# Altium project Ezlo_Voice_AssistantHUB.PrjPcb (part 5 of 10)

## Sheet Power_Sheet_2.SchDoc
size A4; DocumentNumber: 4; SheetNumber: 4; SheetTotal: 27
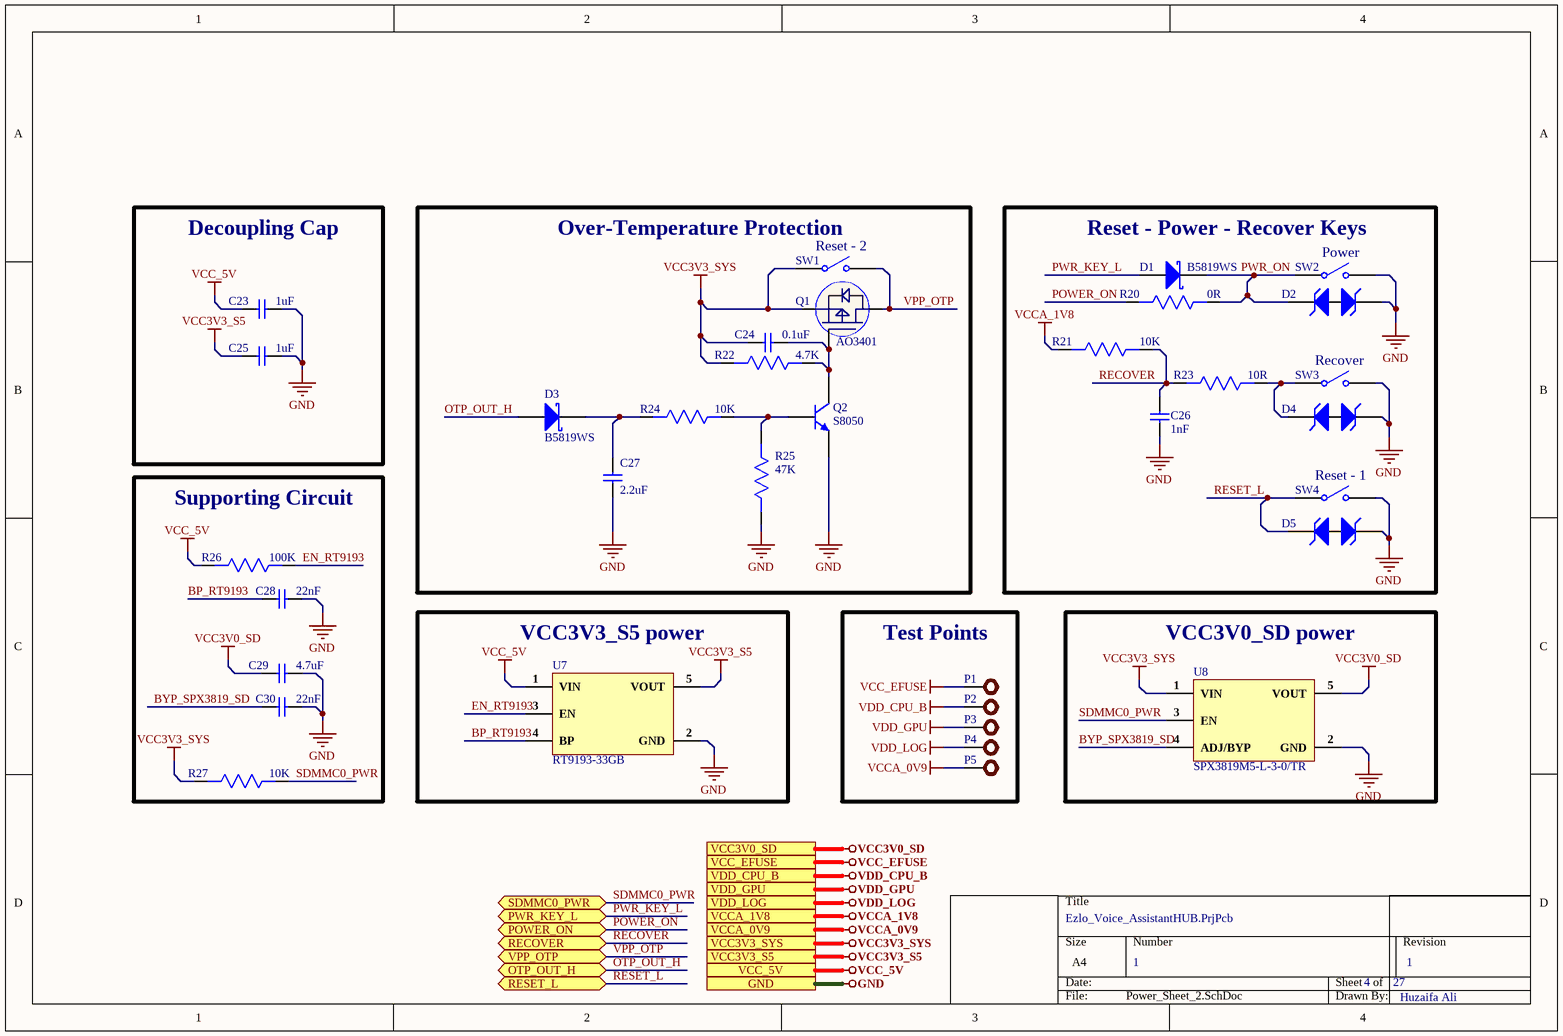
[diagram p7: Power_Sheet_2.SchDoc]

### Parts
C23  1uF  [Cap0402]
C24  0.1uF  [Cap0402]
C25  1uF  [Cap0402]
C26  1nF  [Cap0603]
C27  2.2uF  [Cap0603]
C28  22nF  [Cap0603]
C29  4.7uF  [Cap0603]
C30  22nF  [Cap0603]
D1  B5819WS  [SOD-323]
D2  ESD5451N-2/TR  [DFN1006-2L]  (value not drawn)
D3  B5819WS  [SOD-323]
D4  ESD5451N-2/TR  [DFN1006-2L]  (value not drawn)
D5  ESD5451N-2/TR  [DFN1006-2L]  (value not drawn)
P1  TEST POINT  [TEST POINT]  (value not drawn)
P2  TEST POINT  [TEST POINT]  (value not drawn)
P3  TEST POINT  [TEST POINT]  (value not drawn)
P4  TEST POINT  [TEST POINT]  (value not drawn)
P5  TEST POINT  [TEST POINT]  (value not drawn)
Q1  AO3401  [SOT23-3]
Q2  S8050  [SOT23-3]
R20  0R  [Res0603]
R21  10K  [Res0603]
R22  4.7K  [Res0603]
R23  10R  [Res0603]
R24  10K  [Res0603]
R25  47K  [Res0603]
R26  100K  [Res0603]
R27  10K  [Res0603]
SW1  TS-1185EC-C-D-B  [TS-1185EC-C-D-B]  (value not drawn)
SW2  TS-1185EC-C-D-B  [TS-1185EC-C-D-B]  (value not drawn)
SW3  TS-1185EC-C-D-B  [TS-1185EC-C-D-B]  (value not drawn)
SW4  TS-1185EC-C-D-B  [TS-1185EC-C-D-B]  (value not drawn)
U7  RT9193-33GB  [SOT-23-5]
U8  SPX3819M5-L-3-0/TR  [SOT-23-5]

### Blocks framed on the sheet
Decoupling Cap: C23 C25
Over-Temperature Protection: C24 C27 D3 Q1 Q2 R22 R24 R25 SW1
Reset - Power - Recover Keys: C26 D1 D2 D4 D5 R20 R21 R23 SW2-SW4
Supporting Circuit: C28-C30 R26 R27
VCC3V3_S5 power: U7
Test Points: P1-P5
VCC3V0_SD power: U8

### Ports
GND, OTP_OUT_H (bidir), POWER_ON (bidir), PWR_KEY_L (bidir), RECOVER (bidir), RESET_L (bidir), SDMMC0_PWR (bidir), VCC3V0_SD, VCC3V3_S5, VCC3V3_SYS, VCC_5V, VCC_EFUSE, VCCA_0V9, VCCA_1V8, VDD_CPU_B, VDD_GPU, VDD_LOG, VPP_OTP (bidir)

### Nets
GND: C23.2 C25.2 C26.1 C27.1 C28.2 C29.2 C30.2 D2.1(K) D4.1(K) D5.1(K) Q2.2(E) R25.2 SW2.2 SW3.2 SW4.2 U7.2(GND) U8.2(GND) ; port GND
VCC3V0_SD: C29.1 U8.5(VOUT) ; port VCC3V0_SD
VCC3V3_S5: C25.1 U7.5(VOUT) ; port VCC3V3_S5
VCC3V3_SYS: C24.1 Q1.2(S) R22.2 R27.2 SW1.1 U8.1(VIN) ; port VCC3V3_SYS
VCC_5V: C23.1 R26.2 U7.1(VIN) ; port VCC_5V
VCC_EFUSE: P1.1 ; port VCC_EFUSE
VCCA_0V9: P5.1 ; port VCCA_0V9
VCCA_1V8: R21.2 ; port VCCA_1V8
VDD_CPU_B: P2.1 ; port VDD_CPU_B
VDD_GPU: P3.1 ; port VDD_GPU
VDD_LOG: P4.1 ; port VDD_LOG
BP_RT9193: C28.1 U7.4(BP)
BYP_SPX3819_SD: C30.1 U8.4(ADJ/BYP)
EN_RT9193: R26.1 U7.3(EN)
OTP_OUT_H: D3.2(A) ; port OTP_OUT_H
POWER_ON: R20.2 ; port POWER_ON
PWR_KEY_L: D1.2(A) ; port PWR_KEY_L
PWR_ON: D1.1(K) D2.2(k) R20.1 SW2.1
RECOVER: C26.2 R21.1 R23.2 ; port RECOVER
RESET_L: D5.2(k) SW4.1 ; port RESET_L
SDMMC0_PWR: R27.1 U8.3(EN) ; port SDMMC0_PWR
VPP_OTP: Q1.3(D) SW1.2 ; port VPP_OTP
NetC24_2: C24.2 Q1.1(G) Q2.3(C) R22.1
NetC27_2: C27.2 D3.1(K) R24.2
NetD4_2: D4.2(k) R23.1 SW3.1
NetQ2_1: Q2.1(B) R24.1 R25.1

### Notes on the sheet
- (near SW1) Reset - 2
- (near SW2) Power
- (near SW3) Recover
- (near SW4) Reset - 1
- 1
- Huzaifa Ali

### Library data of the parts
C23 C25 = GRM155R61E105KA12D: CAP CER 1UF 25V X5R 0402; Manufacturer: Murata; Material: Ceramic; Tolerance: 10%; Supplier 1: Digi-Key; Manufacturer Part Number: GRM155R61E105KA12D; Stock 1: 1194305; Pricing 1: 1=0.11, 10=0.077, 100=0.0363, 500=0.02546, 1000=0.02108, 2500=0.01962, 5000=0.01795 (USD); Mount: Surface Mount; Case/Package: 0402; Weight: 0.000212oz; Case Code (Metric): 1005; Case Code (Imperial): 0402; Min Operating Temperature: -55°C; Max Operating Temperature: 85°C; Capacitance: 1uF; Voltage Rating: 25V; Packaging: Tape and Reel; Dielectric: X5R; Voltage: 25V; Termination: SMD/SMT; Voltage Rating (DC): 25V; Package Quantity: 10000; Length: 1mm; Height: 0.5mm; Width: 0.5mm; Thickness: 0.022inch; Depth: 0.5mm; REACH SVHC: No SVHC; Lead Free: Lead Free; ComponentLink1URL: http://www.farnell.com/datasheets/2048341.pdf?src-supplier=Element14; ComponentLink1Description: http://www.farnell.com/datasheets/2048341.pdf?src-supplier=Element14; Supplier Part Number 1: 490-10017-1-ND
C24 = CC0402KRX5R6BB104: CAP CER 0.1UF 10V X5R 0402; Manufacturer: Yageo; Capacitance: 100nF; Tolerance: 10%; Dissipation Factor: 5%; Insulation Resistance: 10GR; Supplier 1: Digi-Key; Manufacturer Part Number: CC0402KRX5R6BB104; RoHS: Yes; Category: Ceramic Capacitors; Stock 1: 6385580; Pricing 1: 1=0.10000, 10=0.02700, 50=0.01500, 100=0.01220, 500=0.00874, 1000=0.00687, 2500=0.00625, 5000=0.00575 (USD); Mount: Surface Mount; Case/Package: 0402; Number of Pins: 2; Case Code (Imperial): 0402; Case Code (Metric): 1005; Min Operating Temperature: -55°C; Max Operating Temperature: 85°C; Dielectric: X5R; Packaging: Tape and Reel; Voltage Rating: 10V; Package Quantity: 1; Termination: SMD/SMT; Voltage Rating (DC): 10V; Series: CC; Length: 1mm; Width: 0.02inch; Height: 0.5mm; Depth: 0.5mm; Thickness: 0.022inch; Radiation Hardening: No; RoHS Compliant: Yes; REACH SVHC: No SVHC; Lead Free: Lead Free; Halogen Free: Halogen Free; ComponentLink1URL: https://datasheet.ciiva.com/144/mlccorderingcode-144029.pdf?src-supplier=Digi-Key; ComponentLink1Description: https://datasheet.ciiva.com/144/mlccorderingcode-144029.pdf?src-supplier=Digi-Key; ComponentLink2URL: https://datasheet.ciiva.com/144/mlccorderingcode-144028.pdf?src-supplier=Digi-Key; ComponentLink2Description: https://datasheet.ciiva.com/144/mlccorderingcode-144028.pdf?src-supplier=Digi-Key; ComponentLink3URL: https://datasheet.ciiva.com/144/mlccorderingcode-144030.pdf?src-supplier=Digi-Key; ComponentLink3Description: https://datasheet.ciiva.com/144/mlccorderingcode-144030.pdf?src-supplier=Digi-Key; ComponentLink4URL: https://datasheet.ciiva.com/7978/1359354-7978091.pdf?src-supplier=Element14; ComponentLink4Description: https://datasheet.ciiva.com/7978/1359354-7978091.pdf?src-supplier=Element14; ComponentLink5URL: https://datasheet.ciiva.com/11587/upy-gphc-x5r-4v-to-50v-12-11587302.pdf?src-supplier=Avnet; ComponentLink5Description: https://datasheet.ciiva.com/11587/upy-gphc-x5r-4v-to-50v-12-11587302.pdf?src-supplier=Avnet; Supplier Part Number 1: 311-1336-1-ND
C26 = CC0603KRX7R8BB102: CAP CER 0603 1nF 25 V ±10 % Tolerance X7R SMT; Manufacturer: Yageo; Tolerance: 10%; Voltage Rating: 25V; Supplier 1: Arrow Electronics; Manufacturer Part Number: CC0603KRX7R8BB102; RoHS: Yes; Category: Ceramic Capacitors; Stock 1: 974; Pricing 1: 1=0.07500, 10=0.04120, 25=0.04030, 100=0.02020, 250=0.02000, 500=0.01320 (USD); Mount: Surface Mount; Case/Package: 0603; Case Code (Imperial): 0603; Case Code (Metric): 1608; Weight: 7.1E-05oz; Min Operating Temperature: -55°C; Max Operating Temperature: 125°C; Capacitance: 1nF; Dielectric: X7R; Packaging: Tape and Reel; Voltage Rating (DC): 25V; Termination: SMD/SMT; Resistor Type: Ceramic; Series: CC; Construction: Flat; Length: 1.6mm; Width: 0.031inch; Height: 0.8mm; Thickness: 0.035inch; Depth: 0.8mm; Radiation Hardening: No; Lead Free: Lead Free; Halogen Free: Halogen Free; RoHS Compliant: Yes; ComponentLink1URL: https://datasheet.ciiva.com/13263/upy-gphc-x7r-6-3v-to-50v-8-12304-13263372.pdf?src-supplier=Mouser; ComponentLink1Description: https://datasheet.ciiva.com/13263/upy-gphc-x7r-6-3v-to-50v-8-12304-13263372.pdf?src-supplier=Mouser; Supplier Part Number 1: CC0603KRX7R8BB102
C27 = CL10A225KA8NNNC: CAP CER 2.2UF 25V X5R 0603; Manufacturer: Samsung; Tolerance: 10%; Supplier 1: Digi-Key; Manufacturer Part Number: CL10A225KA8NNNC; RoHS: Yes; Category: Ceramic Capacitors; Stock 1: 168888; Pricing 1: 1=0.22000, 10=0.15000, 50=0.09000, 100=0.07610, 500=0.05206, 1000=0.04605 (USD); Mount: Surface Mount; Case/Package: 0603; Case Code (Metric): 1608; Case Code (Imperial): 0603; Min Operating Temperature: -55°C; Max Operating Temperature: 85°C; Capacitance: 2.2uF; Packaging: Tape and Reel; Package Quantity: 1; Voltage Rating: 25V; Dielectric: X5R; Voltage Rating (DC): 25V; Series: CL; Construction: Flat; Length: 1.6mm; Width: 0.031inch; Height: 0.8mm; Thickness: 0.035inch; Depth: 0.8mm; Radiation Hardening: No; Lead Free: Lead Free; RoHS Compliant: Yes; ComponentLink1URL: https://datasheet.ciiva.com/25797/cl10a225ka8nnnc-25797781.pdf?src-supplier=Digi-Key; ComponentLink1Description: https://datasheet.ciiva.com/25797/cl10a225ka8nnnc-25797781.pdf?src-supplier=Digi-Key; Supplier Part Number 1: 1276-1879-1-ND
C28 C30 = CC0603KRX7R9BB223: CAP CER 0.022UF 50V X7R 0603; Manufacturer: Yageo; Dielectric Material: Ceramic; Tolerance: 10%; Insulation Resistance: 100GR; Supplier 1: Digi-Key; Manufacturer Part Number: CC0603KRX7R9BB223; RoHS: Yes; Category: Ceramic Capacitors; Stock 1: 119735; Pricing 1: 1=0.10000, 10=0.05500, 50=0.03020, 100=0.02460, 500=0.01760, 1000=0.01383 (USD); Mount: Surface Mount; Case/Package: 0603; Number of Pins: 2; Case Code (Metric): 1608; Case Code (Imperial): 0603; Min Operating Temperature: -55°C; Max Operating Temperature: 125°C; Capacitance: 22nF; Dielectric: X7R; Voltage: 50V; Package Quantity: 1; Voltage Rating: 50V; Packaging: Tape and Reel; Voltage Rating (DC): 50V; Termination: SMD/SMT; Resistor Type: Ceramic; Series: CC; Length: 1.6mm; Width: 0.031inch; Height: 0.8mm; Depth: 0.8mm; Thickness: 0.035inch; Radiation Hardening: No; RoHS Compliant: Yes; REACH SVHC: No SVHC; Lead Free: Lead Free; Halogen Free: Halogen Free; ComponentLink1URL: https://datasheet.ciiva.com/8033/70765-8033869.pdf?src-supplier=Element14; ComponentLink1Description: https://datasheet.ciiva.com/8033/70765-8033869.pdf?src-supplier=Element14; ComponentLink2URL: https://datasheet.ciiva.com/28450/1489800-28450639.pdf?src-supplier=Element14; ComponentLink2Description: https://datasheet.ciiva.com/28450/1489800-28450639.pdf?src-supplier=Element14; ComponentLink3URL: https://datasheet.ciiva.com/8033/1489800-8033867.pdf?src-supplier=Element14; ComponentLink3Description: https://datasheet.ciiva.com/8033/1489800-8033867.pdf?src-supplier=Element14; ComponentLink4URL: https://datasheet.ciiva.com/8033/1489800-8033865.pdf?src-supplier=Element14; ComponentLink4Description: https://datasheet.ciiva.com/8033/1489800-8033865.pdf?src-supplier=Element14; ComponentLink5URL: https://datasheet.ciiva.com/156/mlccorderingcode-156178.pdf?src-supplier=Digi-Key; ComponentLink5Description: https://datasheet.ciiva.com/156/mlccorderingcode-156178.pdf?src-supplier=Digi-Key; ComponentLink6URL: https://datasheet.ciiva.com/156/mlccorderingcode-156177.pdf?src-supplier=Digi-Key; ComponentLink6Description: https://datasheet.ciiva.com/156/mlccorderingcode-156177.pdf?src-supplier=Digi-Key; ComponentLink7URL: https://datasheet.ciiva.com/156/mlccorderingcode-156179.pdf?src-supplier=Digi-Key; ComponentLink7Description: https://datasheet.ciiva.com/156/mlccorderingcode-156179.pdf?src-supplier=Digi-Key; ComponentLink8URL: https://datasheet.ciiva.com/11464/upy-gphc-x7r-6-3v-to-50v-8-11464741.pdf?src-supplier=Avnet; ComponentLink8Description: https://datasheet.ciiva.com/11464/upy-gphc-x7r-6-3v-to-50v-8-11464741.pdf?src-supplier=Avnet; Supplier Part Number 1: 311-1370-1-ND
C29 = CL10A475KA8NQNC: CAP CER 4.7UF 25V X5R 0603; Manufacturer: Samsung; Tolerance: 10%; Supplier 1: Arrow Electronics; Manufacturer Part Number: CL10A475KA8NQNC; RoHS: Yes; Category: Ceramic Capacitors; Stock 1: 260000; Pricing 1: 4000=0.08490, 8000=0.05240, 16000=0.05180, 24000=0.05130, 40000=0.05070 (USD); Mount: Surface Mount; Case/Package: 0603; Case Code (Metric): 1608; Case Code (Imperial): 0603; Contact Plating: Tin; Min Operating Temperature: -55°C; Max Operating Temperature: 85°C; Package Quantity: 1; Packaging: Tape and Reel; Capacitance: 4.7uF; Voltage Rating: 25V; Dielectric: X5R; Series: CL; Termination: Wraparound; Construction: Flat; Length: 1.6mm; Width: 0.031inch; Thickness: 0.035inch; Depth: 0.8mm; Lead Free: Lead Free; RoHS Compliant: Yes; ComponentLink1URL: https://datasheet.ciiva.com/25787/cl10a475ka8nqnc-25787017.pdf?src-supplier=Digi-Key; ComponentLink1Description: https://datasheet.ciiva.com/25787/cl10a475ka8nqnc-25787017.pdf?src-supplier=Digi-Key; Supplier Part Number 1: CL10A475KA8NQNC
D1 D3 = B5819WS: DIODE SCHOTTKY 40V 1A SOD323; Manufacturer: MDD; Manufacturer Part Number: B5819WS-TP; Max Surge Current: 10A; Forward Voltage: 900mV; Max Reverse Leakage Current: 1mA; Element Configuration: Single; Supplier 1: Arrow Electronics; RoHS: Yes; Category: Rectifier Diodes; Stock 1: 1701; Pricing 1: 1=0.34370, 10=0.18990, 25=0.18810, 100=0.11820, 250=0.11700, 500=0.08890, 1000=0.07420 (USD); Mount: Surface Mount; Number of Pins: 2; Min Operating Temperature: -65°C; Max Operating Temperature: 125°C; Package Quantity: 1; Packaging: Tape and Reel; Average Rectified Current: 1A; Peak Non-Repetitive Surge Current: 10A; Max Reverse Voltage (DC): 40V; Series: -; Radiation Hardening: No; RoHS Compliant: Yes; Lead Free: Lead Free; Supplier Part Number 1: B5819WS-TP; ComponentLink1Description: LCSC; ComponentLink1URL: https://lcsc.com/product-detail/Schottky-Barrier-Diodes-SBD_MDD-Microdiode-Electronics-B5819WS_C64886.html
D2 D4 D5 = ESD5451N-2/TR: DFN1006-2L ESD Protection Devices ROHS; Manufacturer: WILLSEMI; ComponentLink1Description: LCSC; ComponentLink1URL: https://www.lcsc.com/product-detail/TVS_Will-Semicon-ESD5451N-2-TR_C239604.html; Manufacturer Part Number: ESD5451N-2/TR
P1-P5 = TEST POINT: Test Point ON
Q1 = AO3401: Trans Mosfet P-ch 30V 4A 3-PIN SOT-23 T/r; Manufacturer: Alpha & Omega Semiconductor; Manufacturer Part Number: AO3401A; Rds On Max: 44mR; Input Capacitance: 1.2nF; Max Power Dissipation: 1.4W; Number of Elements: 1; Supplier 1: Arrow Electronics; RoHS: Yes; Category: MOSFETs; Mount: Surface Mount; Case/Package: TO-236-3; Number of Pins: 3; Min Operating Temperature: -55°C; Max Operating Temperature: 150°C; Packaging: Tape and Reel; Drain to Source Voltage (Vdss): 30V; Continuous Drain Current (ID): 4A; Power Dissipation: 1.4W; Series: -; Radiation Hardening: No; RoHS Compliant: Yes; Lead Free: Lead Free; ComponentLink1URL: https://datasheet.ciiva.com/940/ao3401a-940720.pdf?src-supplier=Digi-Key; ComponentLink1Description: https://datasheet.ciiva.com/940/ao3401a-940720.pdf?src-supplier=Digi-Key; ComponentLink2URL: https://datasheet.ciiva.com/26927/getdatasheetpartid-79048-26927888.pdf?src-supplier=Verical; ComponentLink2Description: https://datasheet.ciiva.com/26927/getdatasheetpartid-79048-26927888.pdf?src-supplier=Verical; Supplier Part Number 1: AO3401A
Q2 = S8050: Trans Gp Bjt NPN 25V 1.5A 300MW 3-PIN SOT-23 T/r; Manufacturer: Comchip; Manufacturer Part Number: SS8050-G; Collector Emitter Voltage (VCEO): 400mV; Transition Frequency: 100MHz; Supplier 1: Arrow Electronics; RoHS: Yes; Stock 1: 2514; Pricing 1: 1=0.26480, 10=0.19960, 25=0.19760, 50=0.19590, 100=0.09990, 250=0.09890, 500=0.07670, 1000=0.05180 (USD); Mount: Surface Mount; Case/Package: TO-236-3; Packaging: Tape and Reel; Max Power Dissipation: 300mW; Max Collector Current: 1.5A; Collector Emitter Breakdown Voltage: 25V; Max Breakdown Voltage: 25V; ComponentLink1URL: http://www.comchiptech.com/admin/files/product/SS8050-G RevA181526.pdf?src-supplier=Digi-Key; ComponentLink1Description: http://www.comchiptech.com/admin/files/product/SS8050-G RevA181526.pdf?src-supplier=Digi-Key; ComponentLink2URL: http://www.comchiptech.com/cms/UserFiles/SS8050-G%20RevA181526.pdf?src-supplier=Digi-Key; ComponentLink2Description: http://www.comchiptech.com/cms/UserFiles/SS8050-G%20RevA181526.pdf?src-supplier=Digi-Key; Supplier Part Number 1: SS8050-G
R20 = RC0603FR-070RL: RES SMD 0R, 1%, 0.1W, 0603; Manufacturer: Yageo; Resistance: 0mR; Power Rating: 100mW; Voltage Rating (DC): 50V; Temperature Coefficient: 200ppm/°C; Current Rating: 1A; Working Voltage: 75V; Supplier 1: Arrow Electronics; Manufacturer Part Number: RC0603FR-070RL; RoHS: Yes; Category: Chip SMD Resistors; Stock 1: 1270000; Pricing 1: 5000=0.00320, 5000=0.00490, 50000=0.00450, 500000=0.00250, 2500000=0.00150 (USD); Case/Package: 0603; Number of Pins: 2; Contact Plating: Tin,Matte; Case Code (Metric): 1608; Case Code (Imperial): 0603; Min Operating Temperature: -55°C; Max Operating Temperature: 155°C; Resistor Type: Thick Film; Packaging: Tape and Reel; Tolerance: 1%; Package Quantity: 5000; Voltage Rating: 50V; Number of Terminations: 2; Termination: SMD/SMT; Max Power Dissipation: 100mW; Features: Moisture Resistant; Length: 1.6mm; Width: 0.031inch; Height: 0.45mm; Depth: 0.8mm; Radiation Hardening: No; REACH SVHC: No SVHC; Lead Free: Lead Free; Military Standard: Not; ComponentLink1URL: https://datasheet.ciiva.com/11808/0900766b80f96399-11808172.pdf?src-supplier=RSComponents; ComponentLink1Description: https://datasheet.ciiva.com/11808/0900766b80f96399-11808172.pdf?src-supplier=RSComponents; ComponentLink2URL: https://datasheet.ciiva.com/5558/rc0603-272842-5558341.pdf?src-supplier=Mouser; ComponentLink2Description: https://datasheet.ciiva.com/5558/rc0603-272842-5558341.pdf?src-supplier=Mouser; ComponentLink3URL: https://datasheet.ciiva.com/46382/443971-46382072.pdf?src-supplier=Element14; ComponentLink3Description: https://datasheet.ciiva.com/46382/443971-46382072.pdf?src-supplier=Element14; ComponentLink4URL: https://datasheet.ciiva.com/29721/pyu-r-int-thick-7-29721178.pdf?src-supplier=Digi-Key; ComponentLink4Description: https://datasheet.ciiva.com/29721/pyu-r-int-thick-7-29721178.pdf?src-supplier=Digi-Key; ComponentLink5URL: https://datasheet.ciiva.com/5684/443971-5684699.pdf?src-supplier=Farnell; ComponentLink5Description: https://datasheet.ciiva.com/5684/443971-5684699.pdf?src-supplier=Farnell; ComponentLink6URL: https://datasheet.ciiva.com/7983/443971-7983627.pdf?src-supplier=Element14; ComponentLink6Description: https://datasheet.ciiva.com/7983/443971-7983627.pdf?src-supplier=Element14; ComponentLink7URL: https://datasheet.ciiva.com/29721/pyu-rc0603-51-rohs-l-4-29721179.pdf?src-supplier=Digi-Key; ComponentLink7Description: https://datasheet.ciiva.com/29721/pyu-rc0603-51-rohs-l-4-29721179.pdf?src-supplier=Digi-Key; ComponentLink8URL: https://datasheet.ciiva.com/22643/1868787-22643388.pdf?src-supplier=Element14; ComponentLink8Description: https://datasheet.ciiva.com/22643/1868787-22643388.pdf?src-supplier=Element14; Supplier Part Number 1: RC0603FR-070RL
R21 R24 R27 = AC0603JR-0710KL: RES SMD 10K OHM 5% 1/10W 0603; Manufacturer: Yageo; Voltage Rating: 50V; Resistance: 10kR; Power Rating: 100mW; Temperature Coefficient: 100ppm/°C; Supplier 1: Future Electronics; Manufacturer Part Number: AC0603JR-0710KL; RoHS: Yes; Category: Chip SMD Resistors; Stock 1: 1533000; Pricing 1: 5000=0.00540 (USD); Case/Package: 0603; Case Code (Imperial): 0603; Case Code (Metric): 1608; Size Code: 0603; Min Operating Temperature: -55°C; Max Operating Temperature: 155°C; Packaging: Tape and Reel; Tolerance: 5%; Package Quantity: 1; Resistor Type: Thick Film; Termination: SMD/SMT; Number of Terminations: 2; Max Power Dissipation: 100mW; Features: Moisture Resistant,Automotive AEC-Q200,Anti-Sulfur; Series: AC; Construction: Rectangular; Length: 0.063inch; Width: 0.031inch; Height: 0.022inch; Depth: 0.8mm; Military Standard: Not; Lead Free: Lead Free; RoHS Compliant: Yes; ComponentLink1URL: https://datasheet.ciiva.com/5562/pyu-ac-51-rohs-l-2-5562553.pdf?src-supplier=Mouser; ComponentLink1Description: https://datasheet.ciiva.com/5562/pyu-ac-51-rohs-l-2-5562553.pdf?src-supplier=Mouser; Supplier Part Number 1: 1029044
R22 = RC0603JR-074K7L: RES SMD 4.7K OHM 5% 1/10W 0603; Manufacturer: Yageo; Resistance: 4.7kR; Temperature Coefficient: 100ppm/°C; Voltage Rating (DC): 50V; Power Rating: 100mW; Supplier 1: Digi-Key; Manufacturer Part Number: RC0603JR-074K7L; Stock 1: 19706643; Pricing 1: 1=0.1, 10=0.02, 100=0.0081, 1000=0.00362, 2500=0.00314 (USD); Case/Package: 0603; Number of Pins: 2; Case Code (Imperial): 0603; Case Code (Metric): 1608; Min Operating Temperature: -55°C; Max Operating Temperature: 155°C; Tolerance: 5%; Composition: Thick Film; Packaging: Tape and Reel; Voltage Rating: 50V; Termination: SMD/SMT; Military Standard: Not; Length: 1.6mm; Width: 0.8mm; Depth: 0.8mm; REACH SVHC: No SVHC; Lead Free: Lead Free; ComponentLink1URL: http://www.farnell.com/datasheets/443971.pdf?src-supplier=Element14; ComponentLink1Description: http://www.farnell.com/datasheets/443971.pdf?src-supplier=Element14; Supplier Part Number 1: 311-4.7KGRCT-ND
R23 = RC0603FR-0710RL: RES SMD 10 OHM 1% 1/10W 0603; Manufacturer: Yageo; Temperature Coefficient: 200ppm/°C; Power Rating: 100mW; Voltage Rating: 50V; Supplier 1: Digi-Key; Manufacturer Part Number: RC0603FR-0710RL; Stock 1: 10836596; Pricing 1: 1=0.1, 10=0.046, 100=0.0187, 1000=0.0084, 2500=0.00729 (USD); Case/Package: 0603; Number of Pins: 2; Case Code (Imperial): 0603; Case Code (Metric): 1608; Contact Plating: Tin,Matte; Min Operating Temperature: -55°C; Max Operating Temperature: 155°C; Resistance: 10R; Tolerance: 1%; Composition: Thick Film; Packaging: Tape and Reel; Voltage Rating (DC): 50V; Termination: SMD/SMT; Military Standard: Not; Length: 1.6mm; Height: 0.45mm; Width: 0.8mm; Depth: 0.8mm; Radiation Hardening: No; Lead Free: Lead Free; REACH SVHC: No SVHC; ComponentLink1URL: http://www.farnell.com/datasheets/1868787.pdf?src-supplier=Element14; ComponentLink1Description: http://www.farnell.com/datasheets/1868787.pdf?src-supplier=Element14; ComponentLink2URL: http://www.yageo.com/documents/recent/PYu-RC0603_51_RoHS_L_4.pdf?src-supplier=Avnet; ComponentLink2Description: http://www.yageo.com/documents/recent/PYu-RC0603_51_RoHS_L_4.pdf?src-supplier=Avnet; ComponentLink3URL: http://documents.rs-components.com/techlib://itc_doclist_GB.htm?stockno=5048984&src-supplier=RSComponents; ComponentLink3Description: http://documents.rs-components.com/techlib://itc_doclist_GB.htm?stockno=5048984&src-supplier=RSComponents; ComponentLink4URL: http://www.yageo.com/documents/recent/PYu-RC0603_51_RoHS_L_4.pdf?src-supplier=Avnet+Europe; ComponentLink4Description: http://www.yageo.com/documents/recent/PYu-RC0603_51_RoHS_L_4.pdf?src-supplier=Avnet+Europe; Supplier Part Number 1: 311-10.0HRDKR-ND
R25 = RC0603JR-0747KL: Res Thick Film 0603 30K Ohm 1% 0.1W(1/10W) ±100ppm/C Epoxy Pad SMD T/R; Manufacturer: Yageo; Resistance: 47kR; Tolerance: 5%; Power Rating: 100mW; Voltage Rating (DC): 50V; Temperature Coefficient: 100ppm/°C; Supplier 1: Arrow; Manufacturer Part Number: RC0603JR-0747KL; Stock 1: 599135; Pricing 1: 5000=0.0025, 10000=0.0022, 25000=0.0019, 1=0.0011, 6000=0.001 (USD); Case/Package: 0603; Number of Pins: 2; Case Code (Imperial): 0603; Case Code (Metric): 1608; Min Operating Temperature: -55°C; Max Operating Temperature: 155°C; Packaging: Tape and Reel; Voltage Rating: 50V; Package Quantity: 5000; Termination: SMD/SMT; Military Standard: Not; Composition: Thick Film; Length: 1.6mm; Height: 0.45mm; Width: 0.8mm; Depth: 0.8mm; REACH SVHC: No SVHC; Lead Free: Lead Free; ComponentLink1URL: http://www.farnell.com/datasheets/443971.pdf; ComponentLink1Description: http://www.farnell.com/datasheets/443971.pdf; ComponentLink2URL: http://www.mouser.com/catalog/specsheets/RC0603.pdf; ComponentLink2Description: http://www.mouser.com/catalog/specsheets/RC0603.pdf; Supplier Part Number 1: RC0603JR-0747KL; Supplier 2: Digi-Key; RoHS: Yes; Category: Chip SMD Resistors; Stock 2: 1087850; Pricing 2: 1=0.10000, 10=0.02300, 100=0.00930, 1000=0.00417, 2500=0.00362 (USD); Size Code: 0603; Number of Terminations: 2; Resistor Type: Thick Film; Features: Moisture Resistant; Series: RC; Max Power Dissipation: 100mW; Construction: Rectangular; Resistance Tolerance: 1%; RoHS Compliant: Yes; ComponentLink3URL: https://datasheet.ciiva.com/46395/443971-46395003.pdf?src-supplier=Element14; ComponentLink3Description: https://datasheet.ciiva.com/46395/443971-46395003.pdf?src-supplier=Element14; ComponentLink4URL: https://datasheet.ciiva.com/12558/rc0603-272842-12558744.pdf?src-supplier=Mouser; ComponentLink4Description: https://datasheet.ciiva.com/12558/rc0603-272842-12558744.pdf?src-supplier=Mouser; Supplier Part Number 2: 311-30.0KHRCT-ND
R26 = RT0603BRD07100KL: RES SMD 100K OHM 0.1% 1/10W 0603; Manufacturer: Yageo; Resistance: 100kR; Temperature Coefficient: 25ppm/°C; Voltage Rating (DC): 75V; Power Rating: 100mW; Supplier 1: Digi-Key; Manufacturer Part Number: RT0603BRD07100KL; Stock 1: 53395; Pricing 1: 1=0.39, 10=0.332, 100=0.1298, 1000=0.05435, 2500=0.04982 (USD); Mount: Surface Mount; Case/Package: 0603; Case Code (Imperial): 0603; Case Code (Metric): 1608; Min Operating Temperature: -55°C; Max Operating Temperature: 125°C; Tolerance: 0.1%; Composition: Thin Film; Packaging: Tape and Reel; Voltage Rating: 75V; Package Quantity: 5000; Termination: SMD/SMT; Number of Terminations: 2; Military Standard: Not; Max Power Dissipation: 100mW; Working Voltage: 75V; Features: Moisture Resistant; Length: 1.6mm; Height: 0.022inch; Width: 0.031inch; Depth: 0.8mm; Lead Free: Lead Free; ComponentLink1URL: http://documents.rs-components.com/techlib://itc_doclist_GB.htm?stockno=6174810&src-supplier=RSComponents; ComponentLink1Description: http://documents.rs-components.com/techlib://itc_doclist_GB.htm?stockno=6174810&src-supplier=RSComponents; Supplier Part Number 1: YAG1235CT-ND
SW1-SW4 = TS-1185EC-C-D-B: 3mm 2mm Round Button 50mA Top3.65mm SPST 12V SMD Tactile Switches; Manufacturer: XKB; Manufacturer Part Number: TS-1185EC-C-D-B; Footprint: Custom; ComponentLink1Description: LCSC; ComponentLink1URL: https://lcsc.com/product-detail/Tactile-Switches_XKB-Connectivity-TS-1185EC-C-D-B_C318893.html
U7 = RT9193-33GB: IC REG LDO 3.3V 0.3A SOT23-5; Manufacturer: Richtek; Dropout Voltage: 220mV; Min Input Voltage: 2.5V; Max Input Voltage: 5.5V; Output Current: 300mA; Number of Regulators: 1; Min Current Limit: 360mA; Supplier 1: Digi-Key; Manufacturer Part Number: RT9193-33GB; RoHS: Yes; Category: Voltage Regulators - Linear; Stock 1: 17182; Pricing 1: 1=0.50000, 10=0.40900, 25=0.37360, 100=0.27810, 250=0.25208, 500=0.20860, 1000=0.15646 (USD); Mount: Surface Mount; Case/Package: SOT-23-5; Number of Pins: 5; Min Operating Temperature: -40°C; Max Operating Temperature: 125°C; Packaging: Tape and Reel; Nominal Output Voltage: 3.3V; Output Voltage: 3.3V; Series: -; REACH SVHC: Unknown; Lead Free: Lead Free; RoHS Compliant: Yes; ComponentLink1URL: https://datasheet.ciiva.com/2046/3d3futf-83fb3frfm5mtkzlte2lnbkzg3d3d3f3d-2046896.pdf?src-supplier=Digi-Key; ComponentLink1Description: https://datasheet.ciiva.com/2046/3d3futf-83fb3frfm5mtkzlte2lnbkzg3d3d3f3d-2046896.pdf?src-supplier=Digi-Key; ComponentLink2URL: https://datasheet.ciiva.com/28652/1782157-28652989.pdf?src-supplier=Element14; ComponentLink2Description: https://datasheet.ciiva.com/28652/1782157-28652989.pdf?src-supplier=Element14; Supplier Part Number 1: 1028-1014-1-ND
U8 = SPX3819M5-L-3-0/TR: SPX3819 Series 3 V Fixed Output 500 mA SMT LDO Regulator - SOT-23-5; Manufacturer: MaxLinear; Max Input Voltage: 16V; Min Output Voltage: 3V; Dropout Voltage: 700mV; Output Current: 500mA; Quiescent Current: 8uA; Output Configuration: Positive; Number of Regulators: 1; Max Supply Current: 30mA; Supplier 1: Mouser; Manufacturer Part Number: SPX3819M5-L-3-0/TR; RoHS: Yes; Stock 1: 2153; Pricing 1: 1=0.68000, 10=0.57700, 50=0.57700, 100=0.40000, 1000=0.26200, 10000=0.21000 (USD); Mount: Surface Mount; Case/Package: SOT-23-5; Min Operating Temperature: -40°C; Max Operating Temperature: 125°C; Packaging: Tape and Reel; Output Type: Fixed; RoHS Compliant: Yes; ComponentLink1URL: https://www.exar.com/content/document.ashx?id=22106&src-supplier=Digi-Key; ComponentLink1Description: https://www.exar.com/content/document.ashx?id=22106&src-supplier=Digi-Key; Supplier Part Number 1: 701-SPX3819M5-L-30TR

## Sheet Controller_Section.SchDoc
size A4; DocumentNumber: 6; SheetNumber: 6; SheetTotal: 27
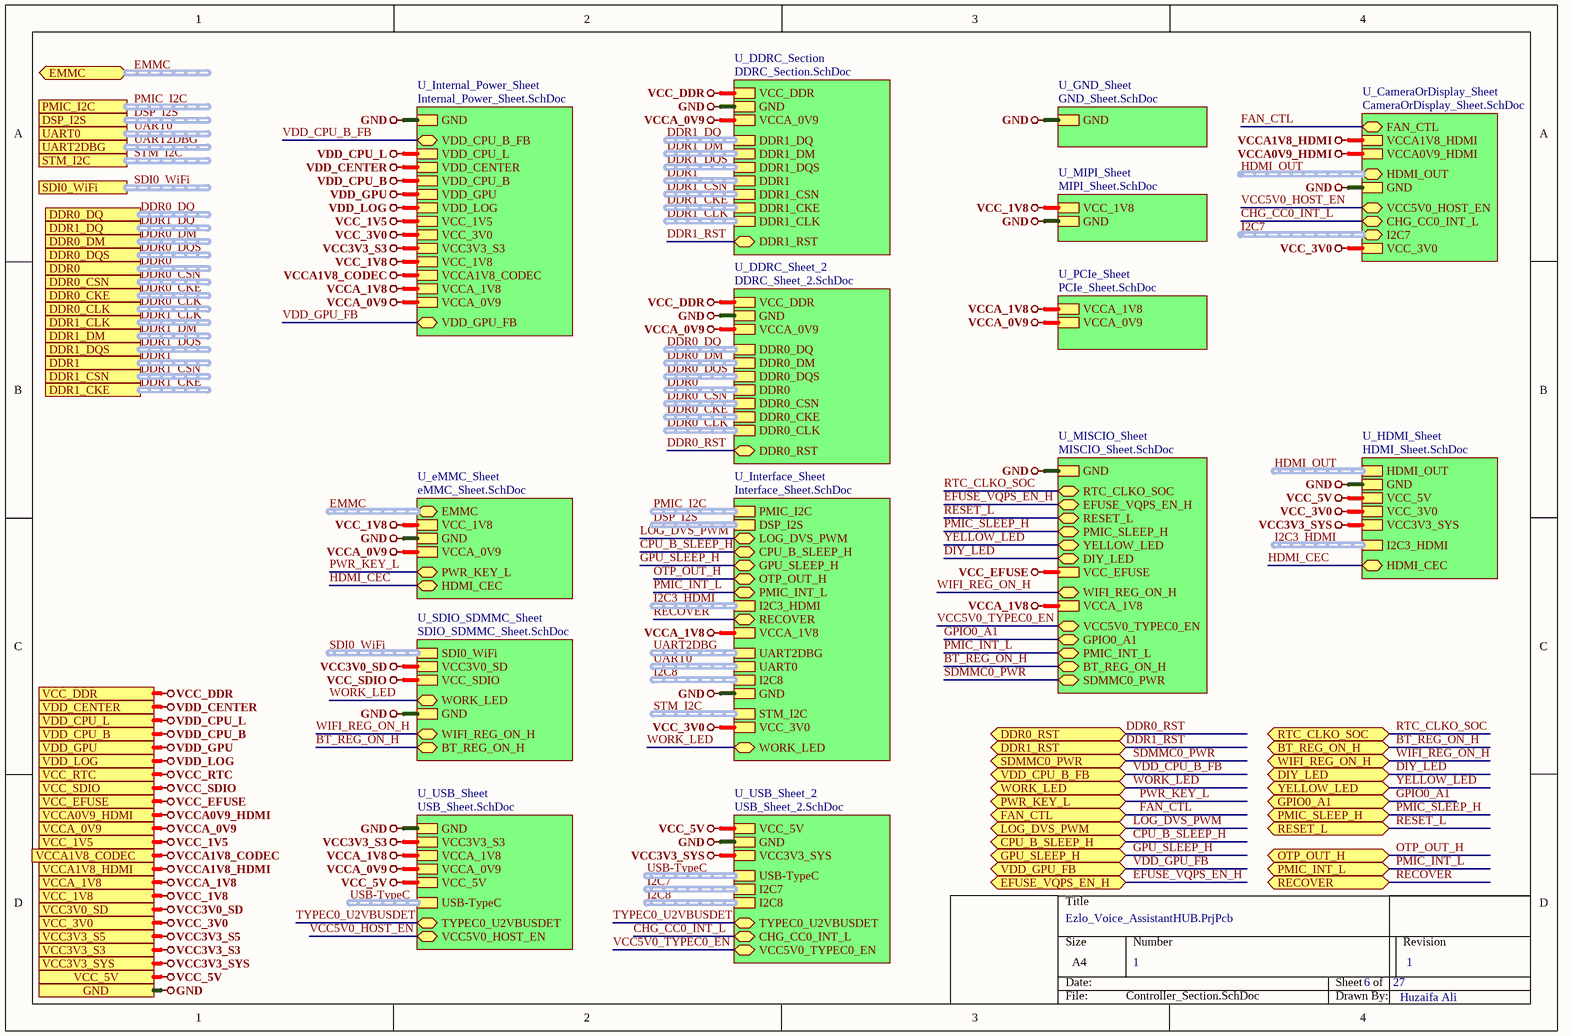
[diagram p8: Controller_Section.SchDoc]

### Sub-sheets
U_CameraOrDisplay_Sheet = CameraOrDisplay_Sheet.SchDoc: FAN_CTL (bidir), VCCA1V8_HDMI, VCCA0V9_HDMI, HDMI_OUT (bidir, harness HDMI_OUT), GND, VCC5V0_HOST_EN (bidir), CHG_CC0_INT_L (bidir), I2C7 (bidir, harness I2C7), VCC_3V0
U_DDRC_Section = DDRC_Section.SchDoc: VCC_DDR, GND, VCCA_0V9, DDR1_DQ (harness DDR1_DQ), DDR1_DM (harness DDR1_DM), DDR1_DQS (harness DDR1_DQS), DDR1 (harness DDR1), DDR1_CSN (harness DDR1_CSN), DDR1_CKE (harness DDR1_CKE), DDR1_CLK (harness DDR1_CLK), DDR1_RST (bidir)
U_DDRC_Sheet_2 = DDRC_Sheet_2.SchDoc: VCC_DDR, GND, VCCA_0V9, DDR0_DQ (harness DDR0_DQ), DDR0_DM (harness DDR0_DM), DDR0_DQS (harness DDR0_DQS), DDR0 (harness DDR0), DDR0_CSN (harness DDR0_CSN), DDR0_CKE (harness DDR0_CKE), DDR0_CLK (harness DDR0_CLK), DDR0_RST (bidir)
U_eMMC_Sheet = eMMC_Sheet.SchDoc: EMMC (bidir, harness EMMC), VCC_1V8, GND, VCCA_0V9, PWR_KEY_L (bidir), HDMI_CEC (bidir)
U_GND_Sheet = GND_Sheet.SchDoc: GND
U_HDMI_Sheet = HDMI_Sheet.SchDoc: HDMI_OUT (harness HDMI_OUT), GND, VCC_5V, VCC_3V0, VCC3V3_SYS, I2C3_HDMI (harness I2C3_HDMI), HDMI_CEC (bidir)
U_Interface_Sheet = Interface_Sheet.SchDoc: PMIC_I2C (harness PMIC_I2C), DSP_I2S (harness DSP_I2S), LOG_DVS_PWM (bidir), CPU_B_SLEEP_H (bidir), GPU_SLEEP_H (bidir), OTP_OUT_H (bidir), PMIC_INT_L (bidir), I2C3_HDMI (harness I2C3_HDMI), RECOVER (bidir), VCCA_1V8, UART2DBG (harness UART2DBG), UART0 (harness UART0), I2C8 (harness I2C8), GND, STM_I2C (harness STM_I2C), VCC_3V0, WORK_LED (bidir)
U_Internal_Power_Sheet = Internal_Power_Sheet.SchDoc: GND, VDD_CPU_B_FB (bidir), VDD_CPU_L, VDD_CENTER, VDD_CPU_B, VDD_GPU, VDD_LOG, VCC_1V5, VCC_3V0, VCC3V3_S3, VCC_1V8, VCCA1V8_CODEC, VCCA_1V8, VCCA_0V9, VDD_GPU_FB (bidir)
U_MIPI_Sheet = MIPI_Sheet.SchDoc: VCC_1V8, GND
U_MISCIO_Sheet = MISCIO_Sheet.SchDoc: GND, RTC_CLKO_SOC (bidir), EFUSE_VQPS_EN_H (bidir), RESET_L (bidir), PMIC_SLEEP_H (bidir), YELLOW_LED (bidir), DIY_LED (bidir), VCC_EFUSE, WIFI_REG_ON_H (bidir), VCCA_1V8, VCC5V0_TYPEC0_EN (bidir), GPIO0_A1 (bidir), PMIC_INT_L (bidir), BT_REG_ON_H (bidir), SDMMC0_PWR (bidir)
U_PCIe_Sheet = PCIe_Sheet.SchDoc: VCCA_1V8, VCCA_0V9
U_SDIO_SDMMC_Sheet = SDIO_SDMMC_Sheet.SchDoc: SDI0_WiFi (harness SDI0_WiFi), VCC3V0_SD, VCC_SDIO, WORK_LED (bidir), GND, WIFI_REG_ON_H (bidir), BT_REG_ON_H (bidir)
U_USB_Sheet = USB_Sheet.SchDoc: GND, VCC3V3_S3, VCCA_1V8, VCCA_0V9, VCC_5V, USB-TypeC (harness USB-TypeC), TYPEC0_U2VBUSDET (bidir), VCC5V0_HOST_EN (bidir)
U_USB_Sheet_2 = USB_Sheet_2.SchDoc: VCC_5V, GND, VCC3V3_SYS, USB-TypeC (harness USB-TypeC), I2C7 (harness I2C7), I2C8 (harness I2C8), TYPEC0_U2VBUSDET (bidir), CHG_CC0_INT_L (bidir), VCC5V0_TYPEC0_EN (bidir)

### Ports
BT_REG_ON_H (bidir), CPU_B_SLEEP_H (bidir), DDR0, DDR0_CKE, DDR0_CLK, DDR0_CSN, DDR0_DM, DDR0_DQ, DDR0_DQS, DDR0_RST (bidir), DDR1, DDR1_CKE, DDR1_CLK, DDR1_CSN, DDR1_DM, DDR1_DQ, DDR1_DQS, DDR1_RST (bidir), DIY_LED (bidir), DSP_I2S (harness DSP_I2S), EFUSE_VQPS_EN_H (bidir), EMMC (bidir, harness EMMC), FAN_CTL (bidir), GND, GPIO0_A1 (bidir), GPU_SLEEP_H (bidir), LOG_DVS_PWM (bidir), OTP_OUT_H (bidir), PMIC_I2C (harness PMIC_I2C), PMIC_INT_L (bidir), PMIC_SLEEP_H (bidir), PWR_KEY_L (bidir), RECOVER (bidir), RESET_L (bidir), RTC_CLKO_SOC (bidir), SDI0_WiFi (harness SDI0_WiFi), SDMMC0_PWR (bidir), STM_I2C (harness STM_I2C), UART0 (harness UART0), UART2DBG (harness UART2DBG), VCC3V0_SD, VCC3V3_S3, VCC3V3_S5, VCC3V3_SYS, VCC_1V5, VCC_1V8, VCC_3V0, VCC_5V, VCC_DDR, VCC_EFUSE, VCC_RTC, VCC_SDIO, VCCA0V9_HDMI, VCCA1V8_CODEC, VCCA1V8_HDMI, VCCA_0V9, VCCA_1V8, VDD_CENTER, VDD_CPU_B, VDD_CPU_B_FB (bidir), VDD_CPU_L, VDD_GPU, VDD_GPU_FB (bidir), VDD_LOG, WIFI_REG_ON_H (bidir), WORK_LED (bidir), YELLOW_LED (bidir)

### Nets
GND: port GND, sheet U_Internal_Power_Sheet/GND, sheet U_GND_Sheet/GND, sheet U_CameraOrDisplay_Sheet/GND, sheet U_eMMC_Sheet/GND, sheet U_MIPI_Sheet/GND, sheet U_HDMI_Sheet/GND, sheet U_USB_Sheet_2/GND, sheet U_USB_Sheet/GND, sheet U_MISCIO_Sheet/GND, sheet U_Interface_Sheet/GND, sheet U_SDIO_SDMMC_Sheet/GND, sheet U_DDRC_Section/GND, sheet U_DDRC_Sheet_2/GND
VCC3V0_SD: port VCC3V0_SD, sheet U_SDIO_SDMMC_Sheet/VCC3V0_SD
VCC3V3_S3: port VCC3V3_S3, sheet U_Internal_Power_Sheet/VCC3V3_S3, sheet U_USB_Sheet/VCC3V3_S3
VCC3V3_SYS: port VCC3V3_SYS, sheet U_HDMI_Sheet/VCC3V3_SYS, sheet U_USB_Sheet_2/VCC3V3_SYS
VCC_1V5: port VCC_1V5, sheet U_Internal_Power_Sheet/VCC_1V5
VCC_1V8: port VCC_1V8, sheet U_Internal_Power_Sheet/VCC_1V8, sheet U_eMMC_Sheet/VCC_1V8, sheet U_MIPI_Sheet/VCC_1V8
VCC_3V0: port VCC_3V0, sheet U_Internal_Power_Sheet/VCC_3V0, sheet U_CameraOrDisplay_Sheet/VCC_3V0, sheet U_HDMI_Sheet/VCC_3V0, sheet U_Interface_Sheet/VCC_3V0
VCC_5V: port VCC_5V, sheet U_HDMI_Sheet/VCC_5V, sheet U_USB_Sheet_2/VCC_5V, sheet U_USB_Sheet/VCC_5V
VCC_DDR: port VCC_DDR, sheet U_DDRC_Section/VCC_DDR, sheet U_DDRC_Sheet_2/VCC_DDR
VCC_EFUSE: port VCC_EFUSE, sheet U_MISCIO_Sheet/VCC_EFUSE
VCC_SDIO: port VCC_SDIO, sheet U_SDIO_SDMMC_Sheet/VCC_SDIO
VCCA0V9_HDMI: port VCCA0V9_HDMI, sheet U_CameraOrDisplay_Sheet/VCCA0V9_HDMI
VCCA1V8_CODEC: port VCCA1V8_CODEC, sheet U_Internal_Power_Sheet/VCCA1V8_CODEC
VCCA1V8_HDMI: port VCCA1V8_HDMI, sheet U_CameraOrDisplay_Sheet/VCCA1V8_HDMI
VCCA_0V9: port VCCA_0V9, sheet U_Internal_Power_Sheet/VCCA_0V9, sheet U_eMMC_Sheet/VCCA_0V9, sheet U_PCIe_Sheet/VCCA_0V9, sheet U_USB_Sheet/VCCA_0V9, sheet U_DDRC_Section/VCCA_0V9, sheet U_DDRC_Sheet_2/VCCA_0V9
VCCA_1V8: port VCCA_1V8, sheet U_Internal_Power_Sheet/VCCA_1V8, sheet U_PCIe_Sheet/VCCA_1V8, sheet U_USB_Sheet/VCCA_1V8, sheet U_MISCIO_Sheet/VCCA_1V8, sheet U_Interface_Sheet/VCCA_1V8
VDD_CENTER: port VDD_CENTER, sheet U_Internal_Power_Sheet/VDD_CENTER
VDD_CPU_B: port VDD_CPU_B, sheet U_Internal_Power_Sheet/VDD_CPU_B
VDD_CPU_L: port VDD_CPU_L, sheet U_Internal_Power_Sheet/VDD_CPU_L
VDD_GPU: port VDD_GPU, sheet U_Internal_Power_Sheet/VDD_GPU
VDD_LOG: port VDD_LOG, sheet U_Internal_Power_Sheet/VDD_LOG
BT_REG_ON_H: port BT_REG_ON_H, sheet U_MISCIO_Sheet/BT_REG_ON_H, sheet U_SDIO_SDMMC_Sheet/BT_REG_ON_H
CHG_CC0_INT_L: sheet U_CameraOrDisplay_Sheet/CHG_CC0_INT_L, sheet U_USB_Sheet_2/CHG_CC0_INT_L
CPU_B_SLEEP_H: port CPU_B_SLEEP_H, sheet U_Interface_Sheet/CPU_B_SLEEP_H
DDR0_RST: port DDR0_RST, sheet U_DDRC_Sheet_2/DDR0_RST
DDR1_RST: port DDR1_RST, sheet U_DDRC_Section/DDR1_RST
DIY_LED: port DIY_LED, sheet U_MISCIO_Sheet/DIY_LED
EFUSE_VQPS_EN_H: port EFUSE_VQPS_EN_H, sheet U_MISCIO_Sheet/EFUSE_VQPS_EN_H
FAN_CTL: port FAN_CTL, sheet U_CameraOrDisplay_Sheet/FAN_CTL
GPIO0_A1: port GPIO0_A1, sheet U_MISCIO_Sheet/GPIO0_A1
GPU_SLEEP_H: port GPU_SLEEP_H, sheet U_Interface_Sheet/GPU_SLEEP_H
HDMI_CEC: sheet U_eMMC_Sheet/HDMI_CEC, sheet U_HDMI_Sheet/HDMI_CEC
LOG_DVS_PWM: port LOG_DVS_PWM, sheet U_Interface_Sheet/LOG_DVS_PWM
OTP_OUT_H: port OTP_OUT_H, sheet U_Interface_Sheet/OTP_OUT_H
PMIC_INT_L: port PMIC_INT_L, sheet U_MISCIO_Sheet/PMIC_INT_L, sheet U_Interface_Sheet/PMIC_INT_L
PMIC_SLEEP_H: port PMIC_SLEEP_H, sheet U_MISCIO_Sheet/PMIC_SLEEP_H
PWR_KEY_L: port PWR_KEY_L, sheet U_eMMC_Sheet/PWR_KEY_L
RECOVER: port RECOVER, sheet U_Interface_Sheet/RECOVER
RESET_L: port RESET_L, sheet U_MISCIO_Sheet/RESET_L
RTC_CLKO_SOC: port RTC_CLKO_SOC, sheet U_MISCIO_Sheet/RTC_CLKO_SOC
SDMMC0_PWR: port SDMMC0_PWR, sheet U_MISCIO_Sheet/SDMMC0_PWR
TYPEC0_U2VBUSDET: sheet U_USB_Sheet_2/TYPEC0_U2VBUSDET, sheet U_USB_Sheet/TYPEC0_U2VBUSDET
VCC5V0_HOST_EN: sheet U_CameraOrDisplay_Sheet/VCC5V0_HOST_EN, sheet U_USB_Sheet/VCC5V0_HOST_EN
VCC5V0_TYPEC0_EN: sheet U_USB_Sheet_2/VCC5V0_TYPEC0_EN, sheet U_MISCIO_Sheet/VCC5V0_TYPEC0_EN
VDD_CPU_B_FB: port VDD_CPU_B_FB, sheet U_Internal_Power_Sheet/VDD_CPU_B_FB
VDD_GPU_FB: port VDD_GPU_FB, sheet U_Internal_Power_Sheet/VDD_GPU_FB
WIFI_REG_ON_H: port WIFI_REG_ON_H, sheet U_MISCIO_Sheet/WIFI_REG_ON_H, sheet U_SDIO_SDMMC_Sheet/WIFI_REG_ON_H
WORK_LED: port WORK_LED, sheet U_Interface_Sheet/WORK_LED, sheet U_SDIO_SDMMC_Sheet/WORK_LED
YELLOW_LED: port YELLOW_LED, sheet U_MISCIO_Sheet/YELLOW_LED

### Buses and harness runs
harness DDR0 = port DDR0
harness DDR0 = sheet U_DDRC_Sheet_2/DDR0
harness DDR0_CKE = port DDR0_CKE
harness DDR0_CKE = sheet U_DDRC_Sheet_2/DDR0_CKE
harness DDR0_CLK = port DDR0_CLK
harness DDR0_CLK = sheet U_DDRC_Sheet_2/DDR0_CLK
harness DDR0_CSN = port DDR0_CSN
harness DDR0_CSN = sheet U_DDRC_Sheet_2/DDR0_CSN
harness DDR0_DM = port DDR0_DM
harness DDR0_DM = sheet U_DDRC_Sheet_2/DDR0_DM
harness DDR0_DQ = port DDR0_DQ
harness DDR0_DQ = sheet U_DDRC_Sheet_2/DDR0_DQ
harness DDR0_DQS = port DDR0_DQS
harness DDR0_DQS = sheet U_DDRC_Sheet_2/DDR0_DQS
harness DDR1 = port DDR1
harness DDR1 = sheet U_DDRC_Section/DDR1
harness DDR1_CKE = port DDR1_CKE
harness DDR1_CKE = sheet U_DDRC_Section/DDR1_CKE
harness DDR1_CLK = port DDR1_CLK
harness DDR1_CLK = sheet U_DDRC_Section/DDR1_CLK
harness DDR1_CSN = port DDR1_CSN
harness DDR1_CSN = sheet U_DDRC_Section/DDR1_CSN
harness DDR1_DM = port DDR1_DM
harness DDR1_DM = sheet U_DDRC_Section/DDR1_DM
harness DDR1_DQ = port DDR1_DQ
harness DDR1_DQ = sheet U_DDRC_Section/DDR1_DQ
harness DDR1_DQS = port DDR1_DQS
harness DDR1_DQS = sheet U_DDRC_Section/DDR1_DQS
harness DSP_I2S = port DSP_I2S
harness DSP_I2S = sheet U_Interface_Sheet/DSP_I2S
harness EMMC = port EMMC
harness EMMC = sheet U_eMMC_Sheet/EMMC
harness HDMI_OUT = sheet U_CameraOrDisplay_Sheet/HDMI_OUT
harness HDMI_OUT = sheet U_HDMI_Sheet/HDMI_OUT
harness I2C3_HDMI = sheet U_HDMI_Sheet/I2C3_HDMI
harness I2C3_HDMI = sheet U_Interface_Sheet/I2C3_HDMI
harness I2C7 = sheet U_CameraOrDisplay_Sheet/I2C7
harness I2C7 = sheet U_USB_Sheet_2/I2C7
harness I2C8 = sheet U_Interface_Sheet/I2C8
harness I2C8 = sheet U_USB_Sheet_2/I2C8
harness PMIC_I2C = port PMIC_I2C
harness PMIC_I2C = sheet U_Interface_Sheet/PMIC_I2C
harness SDI0_WiFi = port SDI0_WiFi
harness SDI0_WiFi = sheet U_SDIO_SDMMC_Sheet/SDI0_WiFi
harness STM_I2C = port STM_I2C
harness STM_I2C = sheet U_Interface_Sheet/STM_I2C
harness UART0 = port UART0
harness UART0 = sheet U_Interface_Sheet/UART0
harness UART2DBG = port UART2DBG
harness UART2DBG = sheet U_Interface_Sheet/UART2DBG
harness USB-TypeC = sheet U_USB_Sheet/USB-TypeC
harness USB-TypeC = sheet U_USB_Sheet_2/USB-TypeC

### Notes on the sheet
- 1
- Huzaifa Ali